# Altium schematic sheet Connector-Sheet.SchDoc
size A4; SheetNumber: 4; SheetTotal: 4
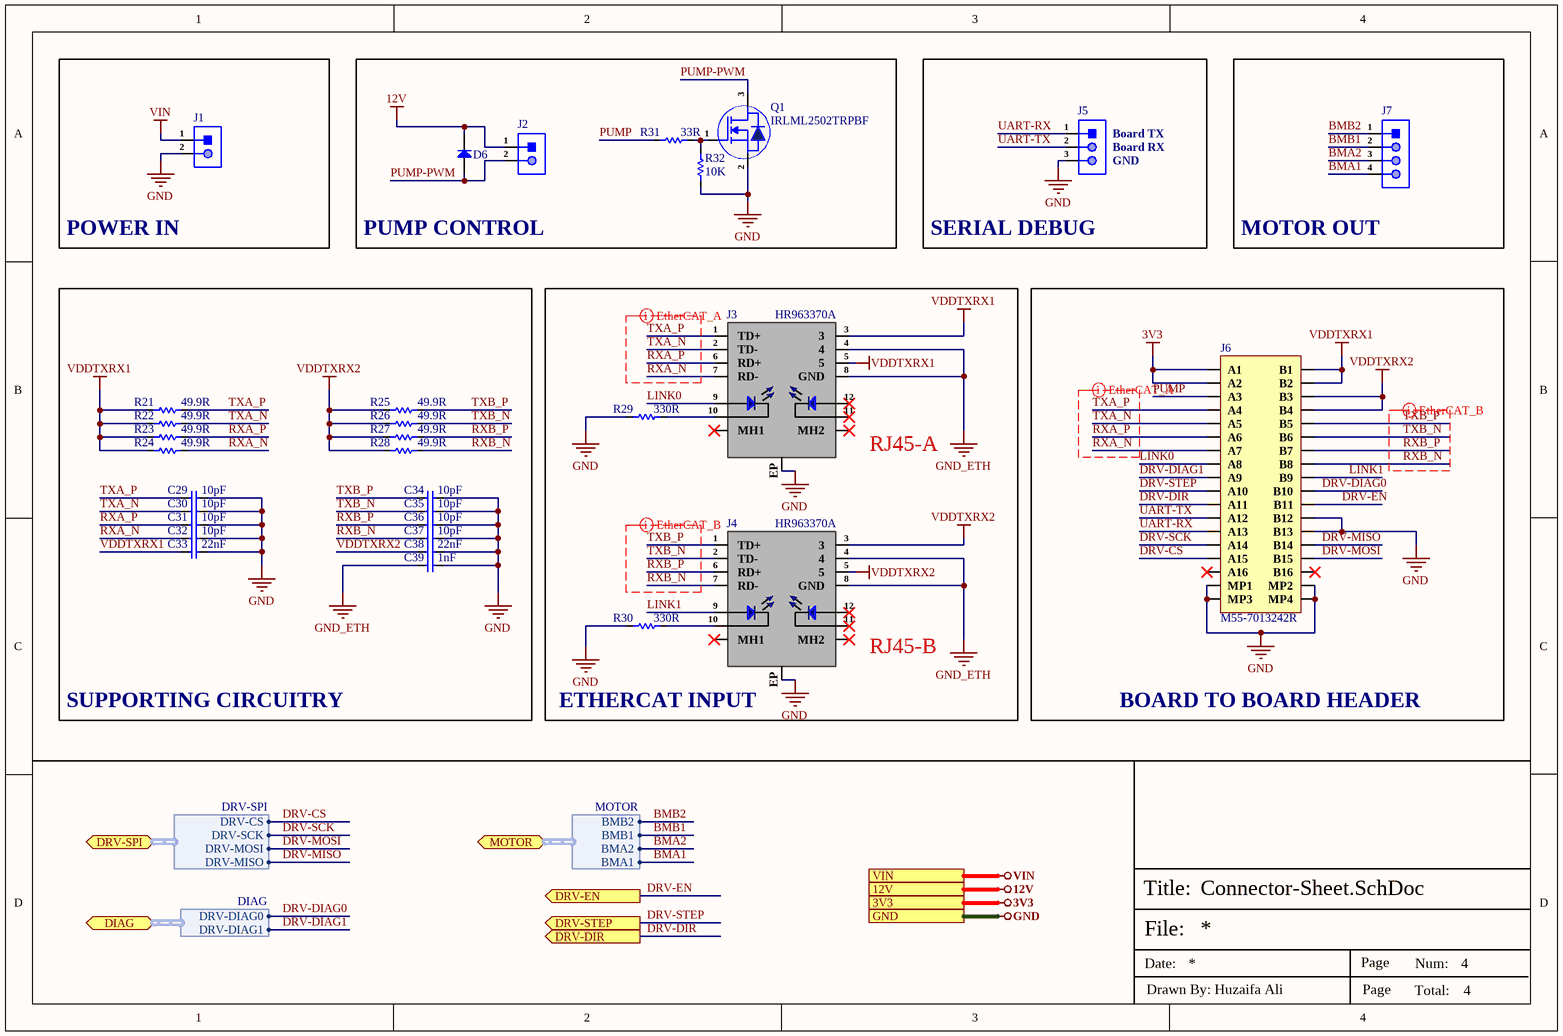
[diagram p0: Connector-Sheet.SchDoc]

## Parts
C29  10pF  [CAP-0201]
C30  10pF  [CAP-0201]
C31  10pF  [CAP-0201]
C32  10pF  [CAP-0201]
C33  22nF  [CAP-0201]
C34  10pF  [CAP-0201]
C35  10pF  [CAP-0201]
C36  10pF  [CAP-0201]
C37  10pF  [CAP-0201]
C38  22nF  [CAP-0201]
C39  1nF  [CAP-0201]
D6  1N4148WT  [SOD-523F]  (value not drawn)
J1  X6511WV-02H-C60D30  [HDR1X2_]  (value not drawn)
J2  X6511WV-02H-C60D30  [HDR1X2_]  (value not drawn)
J3  HR963370A  [HR963370A]
J4  HR963370A  [HR963370A]
J5  X6511WVS-03H-C60D48R1  [HDR1X3-SMD]  (value not drawn)
J6  M55-7013242R  [M55-7013242R]
J7  X6511WV-04H-C60D30  [HDR1X4_]  (value not drawn)
Q1  IRLML2502TRPBF  [SOT-23]
R21  49.9R  [Res-0201]
R22  49.9R  [Res-0201]
R23  49.9R  [Res-0201]
R24  49.9R  [Res-0201]
R25  49.9R  [Res-0201]
R26  49.9R  [Res-0201]
R27  49.9R  [Res-0201]
R28  49.9R  [Res-0201]
R29  330R  [Res-0201]
R30  330R  [Res-0201]
R31  33R  [Res-0201]
R32  10K  [Res-0201]

## Blocks framed on the sheet
POWER IN: J1
PUMP CONTROL: D6 J2 Q1 R31 R32
SERIAL DEBUG: J5
MOTOR OUT: J7
SUPPORTING CIRCUITRY: C29-C39 R21-R28
BOARD TO BOARD HEADER: J6

## Ports
3V3 (see Top-Sheet[2B], Power-Sheet[3D], Stepper-Sheet[3D]), 12V (see Top-Sheet[2B], Power-Sheet[3D], Stepper-Sheet[3D]), DIAG (bidir, harness DIAG, see Top-Sheet[3B], Stepper-Sheet[1D]), DRV-DIR (out, see Top-Sheet[3B], Stepper-Sheet[2D]), DRV-EN (out, see Top-Sheet[3B], Stepper-Sheet[2D]), DRV-SPI (bidir, harness DRV-SPI, see Top-Sheet[3B], Stepper-Sheet[1D]), DRV-STEP (out, see Top-Sheet[3B], Stepper-Sheet[2D]), GND (see Top-Sheet[2B], Power-Sheet[3D], Stepper-Sheet[3D]), MOTOR (bidir, harness MOTOR, see Top-Sheet[3B], Stepper-Sheet[2D]), VIN (see Top-Sheet[2B], Power-Sheet[3D])

## Harnesses
MOTOR: BMB2, BMB1, BMA2, BMA1
DRV-SPI: DRV-CS, DRV-SCK, DRV-MOSI, DRV-MISO
DIAG: DRV-DIAG0, DRV-DIAG1

## Nets
3V3: J6.A1 J6.A2 ; port 3V3
12V: D6.2(K) J2.1 ; port 12V
GND: C29.2 C30.2 C31.2 C32.2 C33.2 C34.2 C35.2 C36.2 C37.2 C38.2 C39.2 J1.2 J3.EP J4.EP J5.3 J6.B12 J6.B13 J6.MP1 J6.MP2 J6.MP3 J6.MP4 Q1.2(S) R29.1 R30.1 R32.1 ; port GND
GND_ETH: C39.1 J3.4 J3.8(GND) J4.4 J4.8(GND)
VDDTXRX1: C33.1 J3.3 J3.5 J6.B1 J6.B2 R21.1 R22.1 R23.1 R24.1
VDDTXRX2: C38.1 J4.3 J4.5 J6.B3 J6.B4 R25.1 R26.1 R27.1 R28.1
VIN: J1.1 ; port VIN
BMA1: J7.4 ; port MOTOR.BMA1
BMA2: J7.3 ; port MOTOR.BMA2
BMB1: J7.2 ; port MOTOR.BMB1
BMB2: J7.1 ; port MOTOR.BMB2
DRV-CS: J6.A15 ; port DRV-SPI.DRV-CS
DRV-DIAG0: J6.B10 ; port DIAG.DRV-DIAG0
DRV-DIAG1: J6.A9 ; port DIAG.DRV-DIAG1
DRV-DIR: J6.A11 ; port DRV-DIR
DRV-EN: J6.B11 ; port DRV-EN
DRV-MISO: J6.B14 ; port DRV-SPI.DRV-MISO
DRV-MOSI: J6.B15 ; port DRV-SPI.DRV-MOSI
DRV-SCK: J6.A14 ; port DRV-SPI.DRV-SCK
DRV-STEP: J6.A10 ; port DRV-STEP
LINK0: J3.9(ANODE) J6.A8
LINK1: J4.9(ANODE) J6.B9
PUMP: J6.A3 R31.1
PUMP-PWM: D6.1(A) J2.2 Q1.3(D)
RXA_N: C32.1 J3.7(RD-) J6.A7 R24.2
RXA_P: C31.1 J3.6(RD+) J6.A6 R23.2
RXB_N: C37.1 J4.7(RD-) J6.B8 R28.2
RXB_P: C36.1 J4.6(RD+) J6.B7 R27.2
TXA_N: C30.1 J3.2(TD-) J6.A5 R22.2
TXA_P: C29.1 J3.1(TD+) J6.A4 R21.2
TXB_N: C35.1 J4.2(TD-) J6.B6 R26.2
TXB_P: C34.1 J4.1(TD+) J6.B5 R25.2
UART-RX: J5.1 J6.A13
UART-TX: J5.2 J6.A12
NetJ3_10: J3.10(CATHODE) R29.2
NetJ4_10: J4.10(CATHODE) R30.2
NetQ1_1: Q1.1(G) R31.2 R32.2

Not connected (* = marked no-connect by the designer): J3 11(CATHODE)* 12(ANODE_)* MH1* MH2*; J4 11(CATHODE)* 12(ANODE_)* MH1* MH2*; J6 A16* B16*

## Layout directives
differential pair; differential pair class EtherCAT_A_Lines; net class EtherCAT_A; rule Matched Net Lengths [Tolerance = 20mil]; rule Impedance Constraint [Min = 85.00    Max = 95.00    ]: RXA_N, RXA_P, TXA_N, TXA_P
differential pair; differential pair class EtherCAT_B_Lines; net class EtherCAT_B; rule Matched Net Lengths [Tolerance = 20mil]; rule Impedance Constraint [Min = 85.00    Max = 95.00    ]: RXB_N, RXB_P, TXB_N, TXB_P

## Notes on the sheet
- (near J5) Board TX
- (near J5) Board RX
- (near J5) GND
- (near J3) RJ45-A
- (near J4) RJ45-B
- (near J4) ETHERCAT INPUT
- File:
- Title:
- Date:
- Page
- Num:
- Total:
- Drawn By: Huzaifa Ali

## Library data of the parts
C29-C32 C34-C37 = CGA1A2C0G1E100D030BA: CAP CER 10PF 25V C0G 0201; Manufacturer: TDK; Item Type: Capacitor; Supplier 1: Digi-Key; Manufacturer Part Number: CGA1A2C0G1E100D030BA; RoHS: Yes; Category: Ceramic Capacitors; Stock 1: 28695; Pricing 1: 1=0.11000, 10=0.07900, 50=0.04340, 100=0.03540, 500=0.02530, 1000=0.01987, 2500=0.01807, 5000=0.01662 (USD); Mount: Surface Mount; Case/Package: 0201; Case Code (Imperial): 0201; Case Code (Metric): 0603; Weight: 6E-06oz; Min Operating Temperature: -55°C; Max Operating Temperature: 125°C; Packaging: Tape and Reel; Capacitance: 10pF; Voltage Rating: 25V; Termination: SMD/SMT; Voltage Rating (DC): 25V; Package Quantity: 1; Dielectric: C0G; Resistor Type: Ceramic; Series: CGA; Length: 0.6mm; Width: 0.3mm; Height: 0.3mm; Thickness: 0.013inch; Depth: 0.3mm; Ratings: AEC-Q200; RoHS Compliant: Yes; ComponentLink1URL: https://datasheet.ciiva.com/24220/cga1a2c0g1e100d030ba-271838-24220873.pdf?src-supplier=Mouser; ComponentLink1Description: https://datasheet.ciiva.com/24220/cga1a2c0g1e100d030ba-271838-24220873.pdf?src-supplier=Mouser; Supplier Part Number 1: 445-9023-1-ND; LCSC Part Number: C2168728
C33 C38 = CC0201KRX5R8BB223: CAP CER 0.022UF 25V X5R 0201; Item Type: Capacitor; Material: 4241ConductorMaterial; Dielectric: 1537DielectricType; LCSC Part Number: C505472; ComponentLink1Description: LCSC; Supplier: Future Electronics; Supplier Part Number: 9164548; RoHS: Yes; Category: Ceramic Capacitors; Stock: 15000; Pricing: 15000=0.0018, 60000=0.0017, 225000=0.0016, 375000=0.0016, 750000=0.0015 (USD); Case/Package: 344Case; Min Operating Temperature: -55°C; Max Operating Temperature: 85°C; Value: 22nF; Voltage Rating: 25V; Voltage Rating (DC): 25V; Height: 330um; Halogen Free: 5694HalogenFree; Lead Free: 5697LeadFree
C39 = CC0201KRX5R8BB102: CAP CER 1000PF 25V X5R 0201; Manufacturer: Yageo; Tolerance: 10%; Supplier 1: Mouser; Manufacturer Part Number: CC0201KRX5R8BB102; RoHS: Yes; Category: Ceramic Capacitors; Stock 1: 54104; Pricing 1: 1=0.10000, 10=0.02600, 50=0.02600, 100=0.01100, 1000=0.00700, 10000=0.00500 (USD); Mount: Surface Mount; Case/Package: 0201; Min Operating Temperature: -55°C; Max Operating Temperature: 85°C; Packaging: Tape and Reel; Capacitance: 1nF; Voltage Rating: 25V; Voltage Rating (DC): 25V; Dielectric: X5R; Length: 0.024inch; Width: 0.012inch; Thickness: 0.013inch; Lead Free: Lead Free; Halogen Free: Halogen Free; RoHS Compliant: Yes; ComponentLink1URL: http://www.yageo.com/documents/recent/UPY-GPHC_X5R_4V-to-50V_25.pdf?src-supplier=Digi-Key; ComponentLink1Description: http://www.yageo.com/documents/recent/UPY-GPHC_X5R_4V-to-50V_25.pdf?src-supplier=Digi-Key; ComponentLink2URL: https://www.yageo.com/upload/media/product/productsearch/datasheet/mlcc/UPY-GPHC_X5R_4V-to-50V_25.pdf?src-supplier=Digi-Key; ComponentLink2Description: https://www.yageo.com/upload/media/product/productsearch/datasheet/mlcc/UPY-GPHC_X5R_4V-to-50V_25.pdf?src-supplier=Digi-Key; ComponentLink3URL: http://www.yageo.com/exep/pages/download/literatures/ProductSelectionGuide%202014_Final_2.pdf?src-supplier=Digi-Key; ComponentLink3Description: http://www.yageo.com/exep/pages/download/literatures/ProductSelectionGuide%202014_Final_2.pdf?src-supplier=Digi-Key; Supplier Part Number 1: 603-CC0201KR8BB102; LCSC Part Number: C541213
D6 = 1N4148WT: DIODE GEN PURP 75V 200MA SOD523F; Manufacturer: ON Semiconductor / Fairchild; Recovery Time: 4ns; Forward Current: 300mA; Max Reverse Current: 5uA; Power Dissipation: 200mW; Max Forward Surge Current (Ifsm): 4A; Element Configuration: Single; Supplier 1: Future Electronics; Manufacturer Part Number: 1N4148WT; RoHS: Yes; Category: Rectifier Diodes; Stock 1: 30; Pricing 1: 1=0.0305, 20=0.0267, 125=0.0246, 750=0.0227, 4000=0.0204 (USD); Mounting Technology: Surface Mount; Pins: 2; Weight: 0.01g; Contact Plating: Tin,Matte; Min Operating Temperature: -55°C; Max Operating Temperature: 150°C; Packaging: Tape and Reel; Package Quantity: 1; Series: -; Reverse Recovery Time: 4ns; Max Repetitive Reverse Voltage (Vrrm): 75V; Average Rectified Current: 200mA; Max Reverse Voltage (DC): 75V; Reverse Recovery Time-Max: 4ns; Length: 1.3mm; Width: 0.9mm; Height: 0.7mm; Radiation Hardening: No; RoHS Compliant: Yes; Lead Free: Lead Free; Reach SVHC Compliant: No; ComponentLink1URL: https://datasheet.ciiva.com/16744/1n4148wt-16744972.pdf?src-supplier=Future+Electronics; ComponentLink1Description: https://datasheet.ciiva.com/16744/1n4148wt-16744972.pdf?src-supplier=Future+Electronics; ComponentLink2URL: https://datasheet.ciiva.com/30479/0900766b810e1cd4-30479226.pdf?src-supplier=Rs; ComponentLink2Description: https://datasheet.ciiva.com/30479/0900766b810e1cd4-30479226.pdf?src-supplier=Rs; ComponentLink3URL: https://datasheet.ciiva.com/15208/getdatasheetpartid-146392-15208359.pdf?src-supplier=Verical; ComponentLink3Description: https://datasheet.ciiva.com/15208/getdatasheetpartid-146392-15208359.pdf?src-supplier=Verical; ComponentLink4URL: https://datasheet.ciiva.com/916/1n914bwt-916865.pdf?src-supplier=Digi-Key; ComponentLink4Description: https://datasheet.ciiva.com/916/1n914bwt-916865.pdf?src-supplier=Digi-Key; ComponentLink5URL: https://datasheet.ciiva.com/916/1n914bwt-916866.pdf?src-supplier=Digi-Key; ComponentLink5Description: https://datasheet.ciiva.com/916/1n914bwt-916866.pdf?src-supplier=Digi-Key; ComponentLink6URL: https://datasheet.ciiva.com/916/1n914bwt-916864.pdf?src-supplier=Digi-Key; ComponentLink6Description: https://datasheet.ciiva.com/916/1n914bwt-916864.pdf?src-supplier=Digi-Key; Supplier Part Number 1: 6145918; LCSC Part Number: C232841; Item Type: Diode
J1 J2 = X6511WV-02H-C60D30: Gold 250V 3A Straight Square Pins 2.5mm 2P 260℃ 6mm -40℃~+105℃ 3mm 2.54mm Plugin Black Brass 1x2P Plugin,P=2.54mm Pin Headers ROHS; Manufacturer: XKB; Item Type: Male Header; Manufacturer Part Number: X6511WV-02H-C60D30; Package: Plugin,P=2.54mm; LCSC Part Number: C706874; ComponentLink1Description: LCSC; ComponentLink1URL: https://www.lcsc.com/product-detail/Pin-Headers_XKB-Connectivity-X6511WV-02H-C60D30_C706874.html
J3 J4 = HR963370A: 1x1 Port Tab upright Surface Mount RJ45 Connector with Integrated Magnetics and LED; Manufacturer: Hanrun; Item Type: Ethernet Connector; Manufacturer Part Number: HR963370A; Package: Custom
J5 = X6511WVS-03H-C60D48R1: Gold 250V 3A Brick nogging Square Pins 2.5mm 3P 260℃ 6mm -40℃~+105℃ 2.54mm Plugin Black Brass 1x3P SMD,P=2.54mm(交错脚) Pin Headers ROHS; Manufacturer: XKB Connectivity; Item Type: Male Header; Manufacturer Part Number: X6511WVS-03H-C60D48R1; Package: SMD,P=2.54mm; LCSC Part Number: C780061; ComponentLink1Description: LCSC; ComponentLink1URL: https://www.lcsc.com/product-detail/Pin-Headers_XKB-Connectivity-X6511WVS-03H-C60D48R1_C780061.html
J6 = M55-7013242R: CONN HDR 1.27MM SMD 32POS; Manufacturer: Harwin; Item Type: Connector Header; Supplier: Mouser; Supplier Part Number: 855-M55-7013242R; Manufacturer Part Number: M55-7013242R; RoHS: Yes; Category: Connectors; Stock: 1347; Pricing: 1=2.13, 10=1.82, 50=1.82, 100=1.63, 1000=1.17, 10000=1.07 (USD)
J7 = X6511WV-04H-C60D30: Gold 250V 3A Straight Square Pins 2.5mm 4P 260℃ 6mm -40℃~+105℃ 3mm 2.54mm Plugin Black Brass 1x4P Plugin,P=2.54mm Pin Headers ROHS; Manufacturer: XKB; Item Type: Male Header; ComponentLink1Description: LCSC; ComponentLink1URL: https://www.lcsc.com/product-detail/Pin-Headers_XKB-Connectivity-X6511WV-04H-C60D30_C706876.html; Manufacturer Part Number: X6511WV-04H-C60D30; Package: Plugin,P=2.54mm; LCSC Part Number: C706876
Q1 = IRLML2502TRPBF: MOSFET N-CH 20V 4.2A SOT23; Manufacturer: Infineon Technologies; Manufacturer Part Number: IRLML2502TRPBF; Package: SOT-23; ComponentLink2URL: https://www.lcsc.com/product-detail/MOSFETs_Infineon-Technologies-IRLML2502TRPBF_C2589.html; ComponentLink2Description: LCSC; LCSC Part Number: C2589; Item Type: Mosfet
R21-R28 = RC0201FR-0749R9L: RES SMD 49.9 OHM 1% 1/20W 0201; Manufacturer: Yageo; Power Rating: 50mW; Voltage Rating: 25V; Temperature Coefficient: 200ppm/°C; Item Type: Resistor; Supplier 1: Avnet; Manufacturer Part Number: RC0201FR-0749R9L; RoHS: Yes; Category: Chip SMD Resistors; Stock 1: 1020000; Pricing 1: 10000=0.00128 (USD); Case/Package: 0201; Case Code (Imperial): 0201; Case Code (Metric): 0603; Size Code: 0201; Min Operating Temperature: -55°C; Max Operating Temperature: 125°C; Packaging: Tape and Reel; Resistance: 49.9R; Tolerance: 1%; Resistor Type: Thick Film; Number of Terminations: 2; Termination: SMD/SMT; Max Power Dissipation: 50mW; Features: Moisture Resistant; Series: RC; Construction: Rectangular; Length: 0.6mm; Width: 0.012inch; Height: 0.01inch; Depth: 0.3mm; Military Standard: Not; Lead Free: Lead Free; RoHS Compliant: Yes; ComponentLink1URL: http://www.yageo.com/documents/recent/PYu-RC0201_51_RoHS_L_(8).pdf?src-supplier=Mouser; ComponentLink1Description: http://www.yageo.com/documents/recent/PYu-RC0201_51_RoHS_L_(8).pdf?src-supplier=Mouser; ComponentLink2URL: http://www.yageo.com/documents/recent/PYu-RC0201_51_RoHS_L_(8).pdf?src-supplier=Future+Electronics; ComponentLink2Description: http://www.yageo.com/documents/recent/PYu-RC0201_51_RoHS_L_(8).pdf?src-supplier=Future+Electronics; ComponentLink3URL: http://www.yageo.com/documents/recent/PYu-RC_Group_51_RoHS_L_10.pdf?src-supplier=Digi-Key; ComponentLink3Description: http://www.yageo.com/documents/recent/PYu-RC_Group_51_RoHS_L_10.pdf?src-supplier=Digi-Key; ComponentLink4URL: http://www.yageo.com/documents/recent/PYu-RC_Group_51_RoHS_L_9.pdf?src-supplier=Digi-Key; ComponentLink4Description: http://www.yageo.com/documents/recent/PYu-RC_Group_51_RoHS_L_9.pdf?src-supplier=Digi-Key; Supplier Part Number 1: RC0201FR-0749R9L; LCSC Part Number: C155744
R29 R30 = RC0201DR-07330RL: RES 330 OHM 0.5% 1/20W 0201; Manufacturer: Yageo; Max Power Dissipation: 50mW; Temperature Coefficient: 200ppm/°C; Item Type: Resistor; Supplier 1: Digi-Key; Manufacturer Part Number: RC0201DR-07330RL; RoHS: Yes; Category: Chip SMD Resistors; Pricing 1: 10000=0.02267 (USD); Case/Package: 0201; Min Operating Temperature: -55°C; Max Operating Temperature: 125°C; Packaging: Tape and Reel; Value: 330R; Number of Terminations: 2; Tolerance: 0.5%; Features: Moisture Resistant; Series: RC; Length: 0.024inch; Width: 0.012inch; Height: 0.01inch; RoHS Compliant: Yes; ComponentLink1URL: http://www.yageo.com.tw/exep/pages/download/literatures/PYu-R_INT-thick_7.pdf?src-supplier=Digi-Key; ComponentLink1Description: http://www.yageo.com.tw/exep/pages/download/literatures/PYu-R_INT-thick_7.pdf?src-supplier=Digi-Key; Supplier Part Number 1: RC0201DR-07330RL-ND; LCSC Part Number: C851717
R31 = RC0201FR-0733RL: RES 33 OHM 1% 1/20W 0201; Manufacturer: Yageo; Item Type: Resistor; Supplier: Future Electronics; Supplier Part Number: 6199285; Manufacturer Part Number: RC0201FR-0733RL; RoHS: Yes; Category: Chip SMD Resistors; Stock: 1420000; Pricing: 10000=0.0013, 50000=0.0012, 250000=0.0012, 750000=0.0011, 2000000=0.001 (USD); ComponentLink1URL: https://datasheet.ciiva.com/2560/pyu-r-int-thick-7-2560877.pdf?src-supplier=Digi-Key; ComponentLink1Description: https://datasheet.ciiva.com/2560/pyu-r-int-thick-7-2560877.pdf?src-supplier=Digi-Key; ComponentLink2URL: https://datasheet.ciiva.com/2560/pyu-r-int-thick-7-2560878.pdf?src-supplier=Digi-Key; ComponentLink2Description: https://datasheet.ciiva.com/2560/pyu-r-int-thick-7-2560878.pdf?src-supplier=Digi-Key; ComponentLink3URL: https://datasheet.ciiva.com/2560/pyu-r-int-thick-7-2560879.pdf?src-supplier=Digi-Key; ComponentLink3Description: https://datasheet.ciiva.com/2560/pyu-r-int-thick-7-2560879.pdf?src-supplier=Digi-Key; ComponentLink4URL: https://datasheet.ciiva.com/7672/1563626-7672223.pdf?src-supplier=Element14; ComponentLink4Description: https://datasheet.ciiva.com/7672/1563626-7672223.pdf?src-supplier=Element14; ComponentLink5URL: https://datasheet.ciiva.com/22698/1563626-22698520.pdf?src-supplier=Element14; ComponentLink5Description: https://datasheet.ciiva.com/22698/1563626-22698520.pdf?src-supplier=Element14; LCSC Part Number: C295794
R32 = RC0201FR-0710KL: RES SMD 10K OHM 1% 1/20W 0201; Manufacturer: Yageo; Item Type: Resistor; Manufacturer Part Number: RC0201FR-0710KL; Package: 0201; ComponentLink7Description: LCSC; ComponentLink7URL: https://www.lcsc.com/product-detail/Chip-Resistor-Surface-Mount_YAGEO-RC0201FR-0710KL_C106225.html; LCSC Part Number: C106225